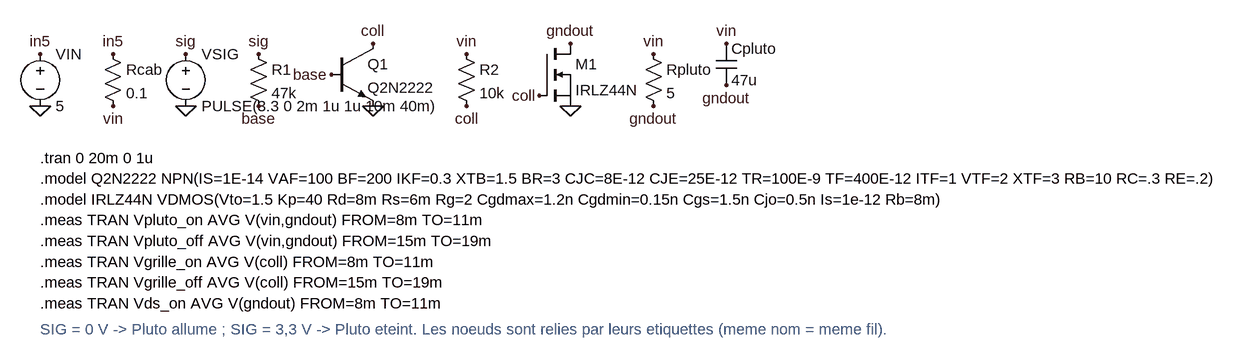
[diagram p0: schematic pluto_2n2222_irlz44n.asc]
pluto_2n2222_irlz44n.asc, the LTspice schematic file:
Version 4
SHEET 1 1300 520
FLAG 0 16 in5
FLAG 0 96 0
FLAG 112 16 in5
FLAG 112 96 vin
FLAG 224 16 sig
FLAG 224 96 0
FLAG 336 16 sig
FLAG 336 96 base
FLAG 448 48 base
FLAG 512 0 coll
FLAG 512 96 0
FLAG 656 16 vin
FLAG 656 96 coll
FLAG 768 80 coll
FLAG 816 0 gndout
FLAG 816 96 0
FLAG 944 16 vin
FLAG 944 96 gndout
FLAG 1056 0 vin
FLAG 1056 64 gndout
SYMBOL voltage 0 0 R0
SYMATTR InstName VIN
SYMATTR Value 5
SYMBOL res 96 0 R0
SYMATTR InstName Rcab
SYMATTR Value 0.1
SYMBOL voltage 224 0 R0
SYMATTR InstName VSIG
SYMATTR Value PULSE(3.3 0 2m 1u 1u 10m 40m)
SYMBOL res 320 0 R0
SYMATTR InstName R1
SYMATTR Value 47k
SYMBOL npn 448 0 R0
SYMATTR InstName Q1
SYMATTR Value Q2N2222
SYMBOL res 640 0 R0
SYMATTR InstName R2
SYMATTR Value 10k
SYMBOL nmos 768 0 R0
SYMATTR InstName M1
SYMATTR Value IRLZ44N
SYMBOL res 928 0 R0
SYMATTR InstName Rpluto
SYMATTR Value 5
SYMBOL cap 1040 0 R0
SYMATTR InstName Cpluto
SYMATTR Value 47u
TEXT 0 176 Left 2 !.tran 0 20m 0 1u
TEXT 0 208 Left 2 !.model Q2N2222 NPN(IS=1E-14 VAF=100 BF=200 IKF=0.3 XTB=1.5 BR=3 CJC=8E-12 CJE=25E-12 TR=100E-9 TF=400E-12 ITF=1 VTF=2 XTF=3 RB=10 RC=.3 RE=.2)
TEXT 0 240 Left 2 !.model IRLZ44N VDMOS(Vto=1.5 Kp=40 Rd=8m Rs=6m Rg=2 Cgdmax=1.2n Cgdmin=0.15n Cgs=1.5n Cjo=0.5n Is=1e-12 Rb=8m)
TEXT 0 272 Left 2 !.meas TRAN Vpluto_on AVG V(vin,gndout) FROM=8m TO=11m
TEXT 0 304 Left 2 !.meas TRAN Vpluto_off AVG V(vin,gndout) FROM=15m TO=19m
TEXT 0 336 Left 2 !.meas TRAN Vgrille_on AVG V(coll) FROM=8m TO=11m
TEXT 0 368 Left 2 !.meas TRAN Vgrille_off AVG V(coll) FROM=15m TO=19m
TEXT 0 400 Left 2 !.meas TRAN Vds_on AVG V(gndout) FROM=8m TO=11m
TEXT 0 440 Left 2 ;SIG = 0 V -> Pluto allume ; SIG = 3,3 V -> Pluto eteint. Les noeuds sont relies par leurs etiquettes (meme nom = meme fil).

The netlist it stands for:
* pluto_2n2222_irlz44n.asc
VIN in5 0 5
Rcab in5 vin 0.1
VSIG sig 0 PULSE(3.3 0 2m 1u 1u 10m 40m)
R1 sig base 47k
Q1 coll base 0 0 Q2N2222
R2 vin coll 10k
M1 gndout coll 0 0 IRLZ44N
Rpluto vin gndout 5
Cpluto vin gndout 47u
.model NPN NPN
.model PNP PNP
.lib standard.bjt
.model NMOS NMOS
.model PMOS PMOS
.lib standard.mos
.tran 0 20m 0 1u
.model Q2N2222 NPN(IS=1E-14 VAF=100 BF=200 IKF=0.3 XTB=1.5 BR=3 CJC=8E-12 CJE=25E-12 TR=100E-9 TF=400E-12 ITF=1 VTF=2 XTF=3 RB=10 RC=.3 RE=.2)
.model IRLZ44N VDMOS(Vto=1.5 Kp=40 Rd=8m Rs=6m Rg=2 Cgdmax=1.2n Cgdmin=0.15n Cgs=1.5n Cjo=0.5n Is=1e-12 Rb=8m)
.meas TRAN Vpluto_on AVG V(vin,gndout) FROM=8m TO=11m
.meas TRAN Vpluto_off AVG V(vin,gndout) FROM=15m TO=19m
.meas TRAN Vgrille_on AVG V(coll) FROM=8m TO=11m
.meas TRAN Vgrille_off AVG V(coll) FROM=15m TO=19m
.meas TRAN Vds_on AVG V(gndout) FROM=8m TO=11m
* SIG = 0 V -> Pluto allume ; SIG = 3,3 V -> Pluto eteint. Les noeuds sont relies par leurs etiquettes (meme nom = meme fil).
.backanno
.end